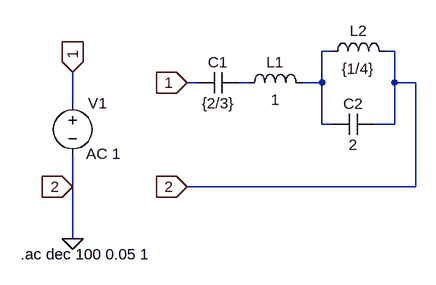
[diagram p0: schematic Draft1.asc]
Draft1.asc, the LTspice schematic file:
Version 4.1
SHEET 1 880 680
WIRE 256 80 240 80
WIRE 352 80 336 80
WIRE 48 128 32 128
WIRE 128 128 112 128
WIRE 240 128 240 80
WIRE 240 128 208 128
WIRE 352 128 352 80
WIRE 384 128 352 128
WIRE -144 160 -144 112
WIRE 240 192 240 128
WIRE 256 192 240 192
WIRE 352 192 352 128
WIRE 352 192 320 192
WIRE -144 288 -144 240
WIRE 384 288 384 128
WIRE 384 288 32 288
WIRE -144 368 -144 288
FLAG 32 128 1
IOPIN 32 128 In
FLAG 32 288 2
IOPIN 32 288 In
FLAG -144 112 1
IOPIN -144 112 In
FLAG -144 288 2
IOPIN -144 288 In
FLAG -144 368 0
SYMBOL cap 112 112 R90
WINDOW 0 0 32 VBottom 2
WINDOW 3 32 32 VTop 2
SYMATTR InstName C1
SYMATTR Value {2/3}
SYMBOL cap 320 176 R90
WINDOW 0 0 32 VBottom 2
WINDOW 3 32 32 VTop 2
SYMATTR InstName C2
SYMATTR Value 2
SYMBOL ind 112 144 R270
WINDOW 0 32 56 VTop 2
WINDOW 3 5 56 VBottom 2
SYMATTR InstName L1
SYMATTR Value 1
SYMATTR SpiceLine Rser=1m
SYMBOL ind 240 96 R270
WINDOW 0 32 56 VTop 2
WINDOW 3 5 56 VBottom 2
SYMATTR InstName L2
SYMATTR Value {1/4}
SYMATTR SpiceLine Rser=1m
SYMBOL voltage -144 144 R0
WINDOW 123 21 93 Left 2
WINDOW 39 0 0 Left 0
SYMATTR InstName V1
SYMATTR Value ""
SYMATTR Value2 AC 1
TEXT -224 392 Left 2 !.ac dec 100 0.05 1

The netlist it stands for:
* Draft1.asc
C1 N002 1 {2/3}
C2 0 N001 2
L1 N002 N001 1 Rser=1m
L2 N001 0 {1/4} Rser=1m
V1 1 0 AC 1
.ac dec 100 0.05 1
.backanno
.end